# Altium schematic sheet Electrode_Sheet1.SchDoc
size 420 x 297 mm
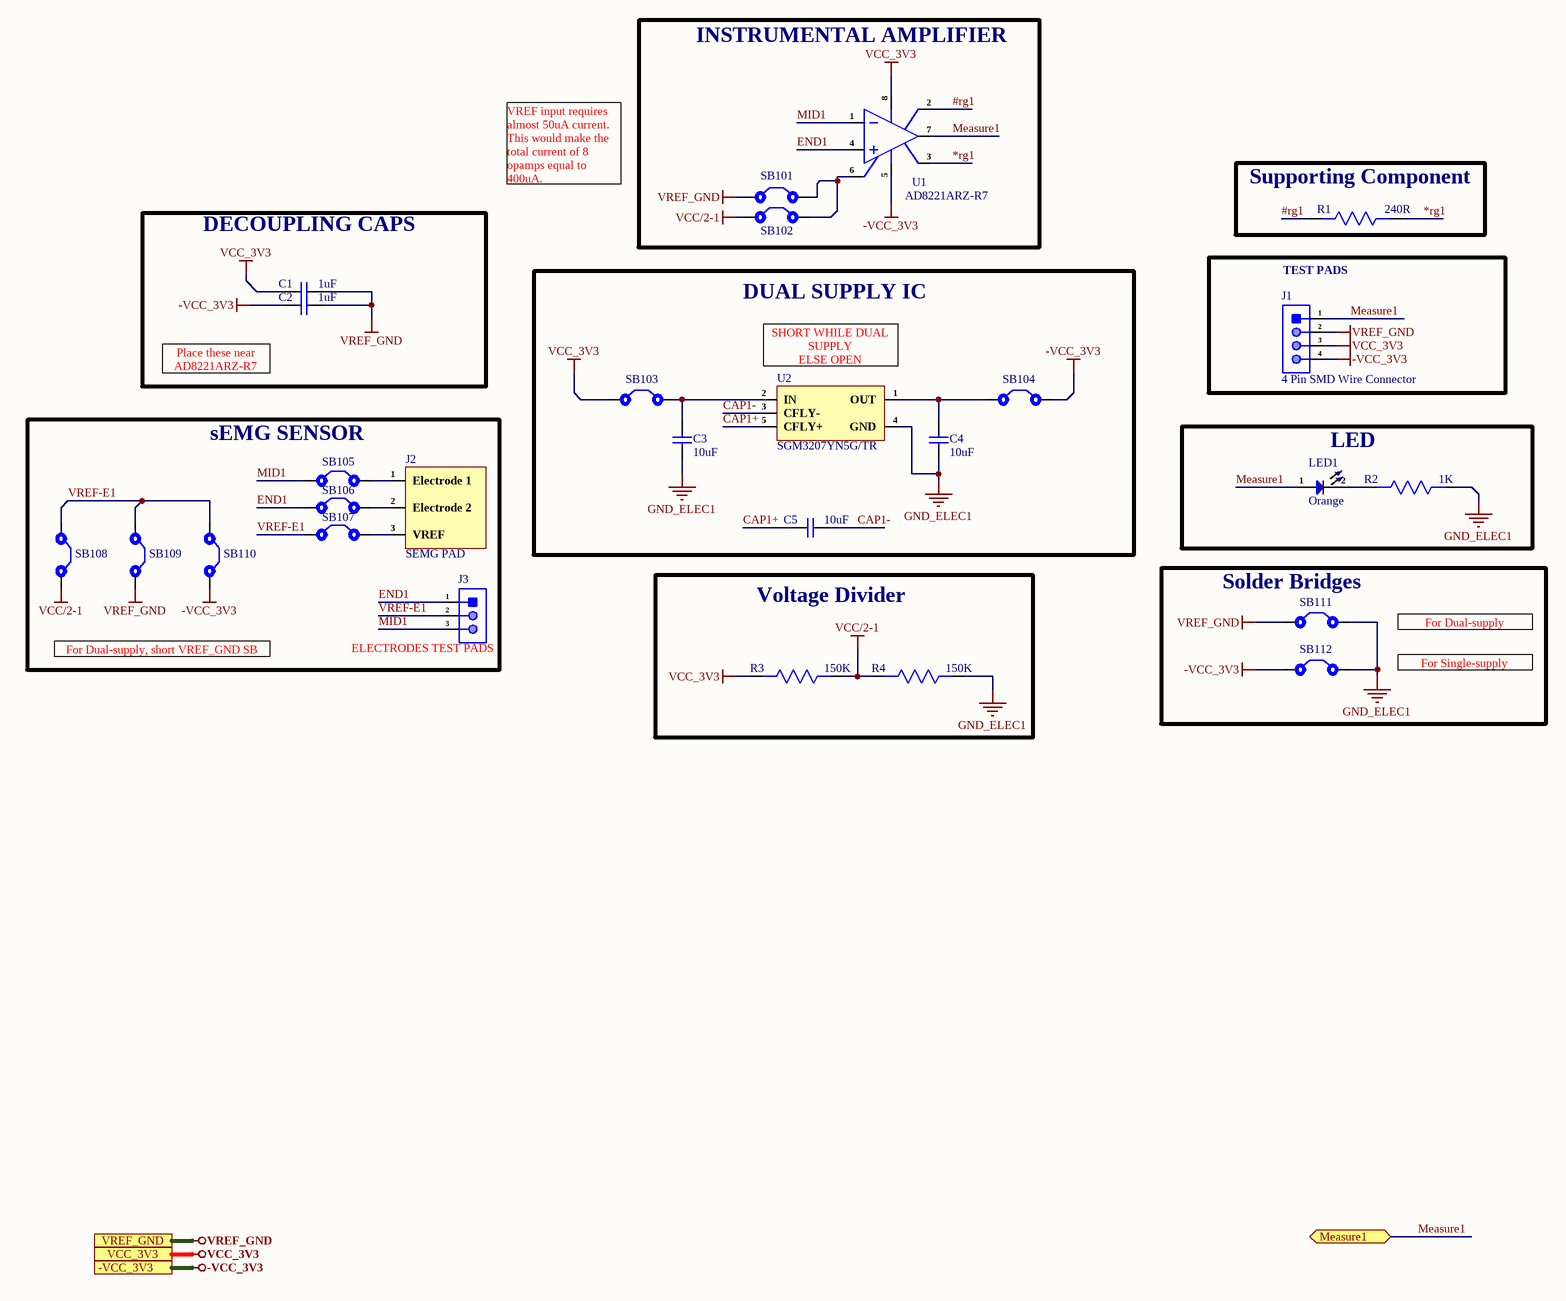
[diagram p0: Electrode_Sheet1.SchDoc]

## Parts
C1  1uF  [Cap-0402]
C2  1uF  [Cap-0402]
C3  10uF  [Cap-0603]
C4  10uF  [Cap-0603]
C5  10uF  [Cap-0603]
J1  4 Pin SMD Wire Connector  [4 Pin SMD Wire CON.]  (no BOM)
J2  SEMG PAD  [SEMG-PAD]
J3  Test Pad SMD 3 Pin  [Test Pad (SMD 3 Pin)]  (value not drawn)  (no BOM)
LED1  Orange  [LED-0603]
R1  240R  [Res-0402]
R2  1K  [Res-0402]
R3  150K  [Res-0402]
R4  150K  [Res-0402]
SB101  Solder Bridge 0402  [Solder Bridge 0402]  (value not drawn)  (no BOM)
SB102  Solder Bridge 0402  [Solder Bridge 0402]  (value not drawn)  (no BOM)
SB103  Solder Bridge 0402  [Solder Bridge 0402]  (value not drawn)  (no BOM)
SB104  Solder Bridge 0402  [Solder Bridge 0402]  (value not drawn)  (no BOM)
SB105  Solder Bridge 0402  [Solder Bridge 0402]  (value not drawn)  (no BOM)
SB106  Solder Bridge 0402  [Solder Bridge 0402]  (value not drawn)  (no BOM)
SB107  Solder Bridge 0402  [Solder Bridge 0402]  (value not drawn)  (no BOM)
SB108  Solder Bridge 0402  [Solder Bridge 0402]  (value not drawn)  (no BOM)
SB109  Solder Bridge 0402  [Solder Bridge 0402]  (value not drawn)  (no BOM)
SB110  Solder Bridge 0402  [Solder Bridge 0402]  (value not drawn)  (no BOM)
SB111  Solder Bridge 0402  [Solder Bridge 0402]  (value not drawn)  (no BOM)
SB112  Solder Bridge 0402  [Solder Bridge 0402]  (value not drawn)  (no BOM)
U1  AD8221ARZ-R7  [SOIC-8]
U2  SGM3207YN5G/TR  [SOT-23-5]

## Blocks framed on the sheet
INSTRUMENTAL AMPLIFIER: SB101 SB102 U1
Supporting Component: R1
DECOUPLING CAPS: C1 C2
TEST PADS: J1
DUAL SUPPLY IC: C3-C5 SB103 SB104 U2
sEMG SENSOR: J2 J3 SB105-SB110
LED: LED1 R2
Voltage Divider: R3 R4
Solder Bridges: SB111 SB112

## Ports
-VCC_3V3, Measure1 (bidir), VCC_3V3, VREF_GND

## Nets
-VCC_3V3: C2.1 J1.4 SB104.2 SB110.2 SB112.1 U1.5(V-) ; port -VCC_3V3
GND_ELEC1: C3.1 C4.1 R2.1 R4.2 SB111.2 SB112.2 U2.4(GND)
VCC/2-1: R3.2 R4.1 SB102.1 SB108.2
VCC_3V3: C1.1 J1.3 R3.1 SB103.1 U1.8(V+) ; port VCC_3V3
VREF_GND: C1.2 C2.2 J1.2 SB101.1 SB109.2 SB111.1 ; port VREF_GND
#rg1: R1.2 U1.2(RG)
*rg1: R1.1 U1.3(RG)
CAP1+: C5.1 U2.5(CFLY+)
CAP1-: C5.2 U2.3(CFLY-)
END1: J3.1 SB106.1 U1.4(IN+)
Measure1: J1.1 LED1.1 U1.7(VOUT) ; port Measure1
MID1: J3.3 SB105.1 U1.1(IN-)
VREF-E1: J3.2 SB107.1 SB108.1 SB109.1 SB110.1
NetC3_2: C3.2 SB103.2 U2.2(IN)
NetC4_2: C4.2 SB104.1 U2.1(OUT)
NetJ2_1: J2.1(Electrode_1) SB105.2
NetJ2_2: J2.2(Electrode_2) SB106.2
NetJ2_3: J2.3(VREF) SB107.2
NetLED1_2: LED1.2 R2.2
NetSB101_2: SB101.2 SB102.2 U1.6(REF)

## Notes on the sheet
- VREF input requires almost 50uA current. This would make the total current of 8 opamps equal to 400uA.
- Place these near AD8221ARZ-R7
- (near U2) SHORT WHILE DUAL SUPPLY
  ELSE OPEN
- For Dual-supply, short VREF_GND SB
- (near J3) ELECTRODES TEST PADS
- For Dual-supply
- For Single-supply
- File:
- Title:
- Date:
- Page
- Num:
- Total:
- Drawn By: Huzaifa Ali

## Library data of the parts
C1 C2 = CC0402KRX5R7BB105: CAP CER 1UF 16V X5R 0402; Manufacturer: Yageo; Tolerance: 10%; Item Type: Capacitor; Supplier 1: Digi-Key; Manufacturer Part Number: CC0402KRX5R7BB105; Stock 1: 1405667; Pricing 1: 1=0.36, 10=0.252, 100=0.1512, 500=0.1134, 1000=0.09576, 2500=0.09072, 5000=0.08568 (USD); Mount: Surface Mount; Case/Package: 0402; Weight: 2.3E-05oz; Case Code (Imperial): 0402; Case Code (Metric): 1005; Min Operating Temperature: -55°C; Max Operating Temperature: 85°C; Capacitance: 1uF; Dielectric: X5R; Packaging: Tape and Reel; Voltage Rating (DC): 16V; Voltage Rating: 16V; Termination: SMD/SMT; Composition: Ceramic; Length: 1mm; Height: 0.5mm; Width: 0.02inch; Thickness: 0.022inch; Depth: 0.5mm; Radiation Hardening: No; Lead Free: Lead Free; Halogen Free: Halogen Free; ComponentLink1URL: http://www.yageo.com/documents/recent/UPY-GPHC_X5R_4V-to-50V_12.pdf?src-supplier=Avnet+Europe; ComponentLink1Description: http://www.yageo.com/documents/recent/UPY-GPHC_X5R_4V-to-50V_12.pdf?src-supplier=Avnet+Europe; Supplier Part Number 1: 311-1691-6-ND; LCSC Part Number: C325464
C3-C5 = CL10A106MA8NRNC: CAP CER 10UF 25V X5R 0603; Manufacturer: Samsung; Tolerance: 20%; Supplier 1: Avnet; Manufacturer Part Number: CL10A106MA8NRNC; RoHS: Yes; Category: Ceramic Capacitors; Pricing 1: 4000=0.03753, 8000=0.03700, 16000=0.03595, 24000=0.03515, 32000=0.03383, 40000=0.03304, 400000=0.03225 (USD); Mount: Surface Mount; Case/Package: 0603; Case Code (Metric): 1608; Case Code (Imperial): 0603; Contact Plating: Tin; Min Operating Temperature: -55°C; Max Operating Temperature: 85°C; Package Quantity: 1; Packaging: Tape and Reel; Capacitance: 10uF; Voltage Rating: 25V; Dielectric: X5R; Termination: Wraparound; Series: CL; Construction: Flat; Length: 0.063inch; Width: 0.031inch; Thickness: 0.035inch; Lead Free: Lead Free; RoHS Compliant: Yes; ComponentLink1URL: https://datasheet.ciiva.com/25766/cl10a106ma8nrnc-25766562.pdf?src-supplier=Digi-Key; ComponentLink1Description: https://datasheet.ciiva.com/25766/cl10a106ma8nrnc-25766562.pdf?src-supplier=Digi-Key; Supplier Part Number 1: CL10A106MA8NRNC; LCSC Part Number: C96446
J1 = 4 Pin SMD Wire Connector: Wire Connecting Pads; Item Type: SMD Pads; Manufacturer Part Number: 4 Pin SMD Wire Connector
J2 = SEMG PAD: Sensor Connecting Pads
J3 = Test Pad SMD 3 Pin: Test Pad
LED1 = 19-217/S2C-AQ1R1B/3T: 0603(H=0.4mm) λD=600.5~612.5nm VR=5V VF=1.7V~2.2V IF=25mA PD=60mW; Manufacturer: Everlight; Item Type: LED; Supplier 1: Digi-Key; Manufacturer Part Number: 19-217/S2C-AQ1R1B/3T; RoHS: No; Category: LEDs; Supplier Part Number 1: 1080-19-217/S2C-AQ1R1B/3TTR-ND; LCSC Part Number: C146215; ComponentLink1Description: LCSC; ComponentLink1URL: https://www.lcsc.com/product-detail/Light-Emitting-Diodes-LED_Everlight-Elec-19-217-S2C-AQ1R1B-3T_C146215.html
R1 = RC0402FR-07240RL: RES 240 OHM 1% 1/16W 0402; Manufacturer: Yageo; Power Rating: 63mW; Temperature Coefficient: 100ppm/°C; Voltage Rating (DC): 50V; Supplier 1: Mouser; Manufacturer Part Number: RC0402FR-07240RL; RoHS: Yes; Category: Chip SMD Resistors; Stock 1: 1903202; Pricing 1: 1=0.10000, 10=0.01200, 50=0.01200, 100=0.00500, 1000=0.00300, 10000=0.00100 (USD); Case/Package: 0402; Case Code (Metric): 1005; Case Code (Imperial): 0402; Size Code: 0402; Min Operating Temperature: -55°C; Max Operating Temperature: 155°C; Resistance: 240R; Tolerance: 1%; Packaging: Tape and Reel; Resistor Type: Thick Film; Voltage Rating: 50V; Package Quantity: 1; Number of Terminations: 2; Termination: SMD/SMT; Max Power Dissipation: 63mW; Features: Moisture Resistant; Series: RC; Construction: Rectangular; Resistance Tolerance: 1%; Length: 1mm; Width: 0.02inch; Height: 0.016inch; Depth: 0.5mm; REACH SVHC: Unknown; Lead Free: Lead Free; RoHS Compliant: Yes; Military Standard: Not; ComponentLink1URL: https://datasheet.ciiva.com/7849/1018594-7849915.pdf?src-supplier=Element14; ComponentLink1Description: https://datasheet.ciiva.com/7849/1018594-7849915.pdf?src-supplier=Element14; ComponentLink2URL: https://datasheet.ciiva.com/7849/1018594-7849916.pdf?src-supplier=Element14; ComponentLink2Description: https://datasheet.ciiva.com/7849/1018594-7849916.pdf?src-supplier=Element14; ComponentLink3URL: https://datasheet.ciiva.com/2519/pyu-r-int-thick-7-2519157.pdf?src-supplier=Digi-Key; ComponentLink3Description: https://datasheet.ciiva.com/2519/pyu-r-int-thick-7-2519157.pdf?src-supplier=Digi-Key; ComponentLink4URL: https://datasheet.ciiva.com/2519/pyu-r-int-thick-7-2519158.pdf?src-supplier=Digi-Key; ComponentLink4Description: https://datasheet.ciiva.com/2519/pyu-r-int-thick-7-2519158.pdf?src-supplier=Digi-Key; ComponentLink5URL: https://datasheet.ciiva.com/2519/pyu-r-int-thick-7-2519156.pdf?src-supplier=Digi-Key; ComponentLink5Description: https://datasheet.ciiva.com/2519/pyu-r-int-thick-7-2519156.pdf?src-supplier=Digi-Key; ComponentLink6URL: https://datasheet.ciiva.com/12669/pyu-rc0402-51-rohs-l-6-r-12669689.pdf?src-supplier=Mouser; ComponentLink6Description: https://datasheet.ciiva.com/12669/pyu-rc0402-51-rohs-l-6-r-12669689.pdf?src-supplier=Mouser; ComponentLink7URL: https://datasheet.ciiva.com/17419/pyu-rc0402-51-rohs-l-6-r-17419482.pdf?src-supplier=Future+Electronics; ComponentLink7Description: https://datasheet.ciiva.com/17419/pyu-rc0402-51-rohs-l-6-r-17419482.pdf?src-supplier=Future+Electronics; Supplier Part Number 1: 603-RC0402FR-07240RL
R2 = RC0402JR-071KL: RES 1K OHM 5% 1/16W 0402; Manufacturer: Yageo; Resistance: 1kR; Power Rating: 62.5mW; Voltage Rating: 50V; Temperature Coefficient: 100ppm/°C; Max Power Dissipation: 63mW; Item Type: Resistor; Supplier 1: Digi-Key; Manufacturer Part Number: RC0402JR-071KL; RoHS: Yes; Category: Chip SMD Resistors; Stock 1: 452315; Pricing 1: 1=0.10000, 10=0.01300, 100=0.00540, 1000=0.00244, 2500=0.00212, 5000=0.00175 (USD); Case/Package: 0402; Case Code (Imperial): 0402; Case Code (Metric): 1005; Size Code: 0402; Min Operating Temperature: -55°C; Max Operating Temperature: 155°C; Tolerance: 5%; Packaging: Tape and Reel; Package Quantity: 1; Termination: SMD/SMT; Resistor Type: Thick Film; Number of Terminations: 2; Features: Moisture Resistant; Series: RC; Resistance Tolerance: 5%; Construction: Rectangular; Length: 0.039inch; Width: 0.02inch; Height: 0.016inch; Depth: 0.5mm; REACH SVHC: No SVHC; Military Standard: Not; Lead Free: Lead Free; RoHS Compliant: Yes; ComponentLink1URL: https://datasheet.ciiva.com/7983/1018594-7983558.pdf?src-supplier=Element14; ComponentLink1Description: https://datasheet.ciiva.com/7983/1018594-7983558.pdf?src-supplier=Element14; ComponentLink2URL: https://datasheet.ciiva.com/2452/pyu-r-int-thick-7-2452756.pdf?src-supplier=Digi-Key; ComponentLink2Description: https://datasheet.ciiva.com/2452/pyu-r-int-thick-7-2452756.pdf?src-supplier=Digi-Key; ComponentLink3URL: https://datasheet.ciiva.com/2452/pyu-r-int-thick-7-2452757.pdf?src-supplier=Digi-Key; ComponentLink3Description: https://datasheet.ciiva.com/2452/pyu-r-int-thick-7-2452757.pdf?src-supplier=Digi-Key; ComponentLink4URL: https://datasheet.ciiva.com/2452/pyu-r-int-thick-7-2452755.pdf?src-supplier=Digi-Key; ComponentLink4Description: https://datasheet.ciiva.com/2452/pyu-r-int-thick-7-2452755.pdf?src-supplier=Digi-Key; ComponentLink5URL: https://datasheet.ciiva.com/7850/1018594-7850170.pdf?src-supplier=Element14; ComponentLink5Description: https://datasheet.ciiva.com/7850/1018594-7850170.pdf?src-supplier=Element14; ComponentLink6URL: https://datasheet.ciiva.com/7850/1018594-7850171.pdf?src-supplier=Element14; ComponentLink6Description: https://datasheet.ciiva.com/7850/1018594-7850171.pdf?src-supplier=Element14; ComponentLink7URL: https://datasheet.ciiva.com/17081/pyu-rc0402-51-rohs-l-6-r-17081438.pdf?src-supplier=Future+Electronics; ComponentLink7Description: https://datasheet.ciiva.com/17081/pyu-rc0402-51-rohs-l-6-r-17081438.pdf?src-supplier=Future+Electronics; Supplier Part Number 1: 311-1.0KJRCT-ND; LCSC Part Number: C105637
R3 R4 = RC0402JR-07150KL: RES SMD 0402 150kOhm 5% Paper T/R; Manufacturer: Yageo; Resistance: 150kR; Power Rating: 63mW; Voltage Rating: 50V; Temperature Coefficient: 100ppm/°C; Item Type: Resistor; Supplier 1: Arrow Electronics; Manufacturer Part Number: RC0402JR-07150KL; RoHS: Yes; Category: Chip SMD Resistors; Stock 1: 170000; Pricing 1: 10000=0.00100 (USD); Case/Package: 0402; Case Code (Metric): 1005; Case Code (Imperial): 0402; Weight: 2.3E-05oz; Size Code: 0402; Min Operating Temperature: -55°C; Max Operating Temperature: 155°C; Package Quantity: 1; Tolerance: 5%; Packaging: Tape and Reel; Resistor Type: Thick Film; Number of Terminations: 2; Termination: SMD/SMT; Max Power Dissipation: 63mW; Features: Moisture Resistant; Series: RC; Construction: Rectangular; Resistance Tolerance: 5%; Length: 1mm; Width: 0.02inch; Height: 0.016inch; Depth: 0.5mm; REACH SVHC: No SVHC; Military Standard: Not; Lead Free: Lead Free; RoHS Compliant: Yes; ComponentLink1URL: https://datasheet.ciiva.com/7983/1018594-7983551.pdf?src-supplier=Element14; ComponentLink1Description: https://datasheet.ciiva.com/7983/1018594-7983551.pdf?src-supplier=Element14; ComponentLink2URL: https://datasheet.ciiva.com/2518/pyu-r-int-thick-7-2518929.pdf?src-supplier=Digi-Key; ComponentLink2Description: https://datasheet.ciiva.com/2518/pyu-r-int-thick-7-2518929.pdf?src-supplier=Digi-Key; ComponentLink3URL: https://datasheet.ciiva.com/2518/pyu-r-int-thick-7-2518930.pdf?src-supplier=Digi-Key; ComponentLink3Description: https://datasheet.ciiva.com/2518/pyu-r-int-thick-7-2518930.pdf?src-supplier=Digi-Key; ComponentLink4URL: https://datasheet.ciiva.com/2518/pyu-r-int-thick-7-2518928.pdf?src-supplier=Digi-Key; ComponentLink4Description: https://datasheet.ciiva.com/2518/pyu-r-int-thick-7-2518928.pdf?src-supplier=Digi-Key; ComponentLink5URL: https://datasheet.ciiva.com/7850/1018594-7850149.pdf?src-supplier=Element14; ComponentLink5Description: https://datasheet.ciiva.com/7850/1018594-7850149.pdf?src-supplier=Element14; ComponentLink6URL: https://datasheet.ciiva.com/17072/pyu-rc0402-51-rohs-l-6-r-17072379.pdf?src-supplier=Future+Electronics; ComponentLink6Description: https://datasheet.ciiva.com/17072/pyu-rc0402-51-rohs-l-6-r-17072379.pdf?src-supplier=Future+Electronics; ComponentLink7URL: https://datasheet.ciiva.com/15189/getdatasheetpartid-251830-15189543.pdf?src-supplier=Verical; ComponentLink7Description: https://datasheet.ciiva.com/15189/getdatasheetpartid-251830-15189543.pdf?src-supplier=Verical; Supplier Part Number 1: RC0402JR-07150KL; LCSC Part Number: C137919
SB101-SB112 = Solder Bridge 0402: Solder Bridge ON; Manufacturer Part Number: Solder Bridge 0402; Item Type: Solder Bridge
U1 = AD8221ARZ-R7: IC OPAMP INSTR 825KHZ 8SOIC; Manufacturer: Analog Devices; Number of Channels: 1; Common Mode Rejection Ratio: 80dB; Min Dual Supply Voltage: 2.3V; Max Dual Supply Voltage: 18V; Slew Rate: 2.5V/µs; Nominal Supply Current: 1mA; Max Power Dissipation: 200mW; Bandwidth: 562kHz; Input Bias Current: 1.5nA; Input Offset Voltage (Vos): 60uV; Output Current per Channel: 18mA; Power Supply Rejection Ratio (PSRR): 130dB; Voltage Gain: 60dB; Input Resistance: 100GR; Quiescent Current: 900uA; Operating Supply Voltage: 36V; Supplier 1: Mouser; Manufacturer Part Number: AD8221ARZ-R7; RoHS: Yes; Category: Amplifiers - Op Amps, Buffer, Instrumentation; Pricing 1: 1=7.37000, 10=6.66000, 25=6.35000, 50=6.35000, 100=5.51000, 250=5.27000, 500=4.80000, 1000=4.37000, 10000=4.37000 (USD); Case/Package: SOIC; Number of Pins: 8; Contact Plating: Tin,Matte; Min Operating Temperature: -40°C; Max Operating Temperature: 85°C; -3db Bandwidth: 825kHz; Package Quantity: 1000; Packaging: Tape and Reel; Number of Circuits: 1; Operating Supply Current: 1mA; Number of Elements: 1; Power Dissipation: 200mW; Series: -; Supply Current: 1mA; Radiation Hardening: No; Lead Free: Contains Lead; RoHS Compliant: Yes; ComponentLink1URL: https://datasheet.ciiva.com/15128/getdatasheetpartid-313520-15128733.pdf?src-supplier=Verical; ComponentLink1Description: https://datasheet.ciiva.com/15128/getdatasheetpartid-313520-15128733.pdf?src-supplier=Verical; ComponentLink2URL: https://datasheet.ciiva.com/2975/ad8221-2975658.pdf?src-supplier=Avnet; ComponentLink2Description: https://datasheet.ciiva.com/2975/ad8221-2975658.pdf?src-supplier=Avnet; ComponentLink3URL: https://datasheet.ciiva.com/2975/ad8221-2975980.pdf?src-supplier=Avnet; ComponentLink3Description: https://datasheet.ciiva.com/2975/ad8221-2975980.pdf?src-supplier=Avnet; ComponentLink4URL: https://datasheet.ciiva.com/6628/ad8221-6628618.pdf?src-supplier=Digi-Key; ComponentLink4Description: https://datasheet.ciiva.com/6628/ad8221-6628618.pdf?src-supplier=Digi-Key; ComponentLink5URL: https://datasheet.ciiva.com/6628/ad8221-6628619.pdf?src-supplier=Digi-Key; ComponentLink5Description: https://datasheet.ciiva.com/6628/ad8221-6628619.pdf?src-supplier=Digi-Key; ComponentLink6URL: https://datasheet.ciiva.com/6628/ad8221-6628617.pdf?src-supplier=Digi-Key; ComponentLink6Description: https://datasheet.ciiva.com/6628/ad8221-6628617.pdf?src-supplier=Digi-Key; ComponentLink7URL: https://datasheet.ciiva.com/48709/001249009-da-01-en-ic-amp-inst-prec-ad8221arz-r7-soic-8-adi-48709526.pdf?src-supplier=Conrad; ComponentLink7Description: https://datasheet.ciiva.com/48709/001249009-da-01-en-ic-amp-inst-prec-ad8221arz-r7-soic-8-adi-48709526.pdf?src-supplier=Conrad; Supplier Part Number 1: 584-AD8221ARZ-R7; LCSC Part Number: C13342; Item Type: IC
U2 = SGM3207YN5G/TR: NO Charge pump 1 -5.5V~-1.4V 1.4V~5.5V 60mA 19kHz SOT-23-5 DC-DC Converters ROHS; Manufacturer: SG Micro; Item Type: IC; Supplier 1: Avnet; Manufacturer Part Number: SGM3207YN5G/TR; RoHS: No; Category: Uncategorized; Pricing 1: 3000=0.38750, 6000=0.36250, 12000=0.33750, 18000=0.32500, 24000=0.31250, 30000=0.31250, 300000=0.30500 (USD); LCSC Part Number: C80403; Supplier Part Number 1: SGM3207YN5G/TR